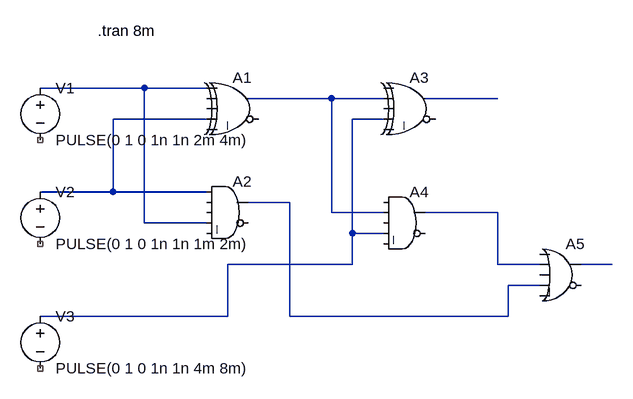
[diagram p0: schematic FA.asc]
FA.asc, the LTspice schematic file:
Version 4.1
SHEET 1 964 680
WIRE 240 48 80 48
WIRE 336 48 240 48
WIRE 528 64 400 64
WIRE 608 64 528 64
WIRE 784 64 672 64
WIRE 336 96 192 96
WIRE 608 96 560 96
WIRE 192 208 192 96
WIRE 192 208 80 208
WIRE 336 208 192 208
WIRE 464 224 400 224
WIRE 528 240 528 64
WIRE 608 240 528 240
WIRE 784 240 672 240
WIRE 240 256 240 48
WIRE 336 256 240 256
WIRE 560 272 560 96
WIRE 608 272 560 272
WIRE 560 320 560 272
WIRE 560 320 368 320
WIRE 784 320 784 240
WIRE 848 320 784 320
WIRE 960 320 912 320
WIRE 848 352 800 352
WIRE 368 400 368 320
WIRE 368 400 80 400
WIRE 464 400 464 224
WIRE 800 400 800 352
WIRE 800 400 464 400
SYMBOL voltage 80 32 R0
WINDOW 123 0 0 Left 0
WINDOW 39 0 0 Left 0
SYMATTR InstName V1
SYMATTR Value PULSE(0 1 0 1n 1n 2m 4m)
SYMBOL voltage 80 192 R0
WINDOW 123 0 0 Left 0
WINDOW 39 0 0 Left 0
SYMATTR InstName V2
SYMATTR Value PULSE(0 1 0 1n 1n 1m 2m)
SYMBOL Digital\\xor 384 16 R0
SYMATTR InstName A1
SYMBOL Digital\\and 368 176 R0
SYMATTR InstName A2
SYMBOL voltage 80 384 R0
WINDOW 123 0 0 Left 0
WINDOW 39 0 0 Left 0
SYMATTR InstName V3
SYMATTR Value PULSE(0 1 0 1n 1n 4m 8m)
SYMBOL Digital\\xor 656 16 R0
SYMATTR InstName A3
SYMBOL Digital\\and 640 192 R0
SYMATTR InstName A4
SYMBOL Digital\\or 880 272 R0
SYMATTR InstName A5
TEXT 168 -40 Left 2 !.tran 8m

The netlist it stands for:
* FA.asc
V1 N001 NC_01 PULSE(0 1 0 1n 1n 2m 4m)
V2 N004 NC_02 PULSE(0 1 0 1n 1n 1m 2m)
A1 N001 0 0 N004 0 0 N002 0 XOR
A2 N004 0 0 N001 0 0 N006 0 AND
V3 N005 NC_03 PULSE(0 1 0 1n 1n 4m 8m)
A3 0 N002 0 N005 0 0 N003 0 XOR
A4 0 N002 0 N005 0 0 N007 0 AND
A5 0 N007 0 N006 0 0 N008 0 OR
.tran 8m
.backanno
.end